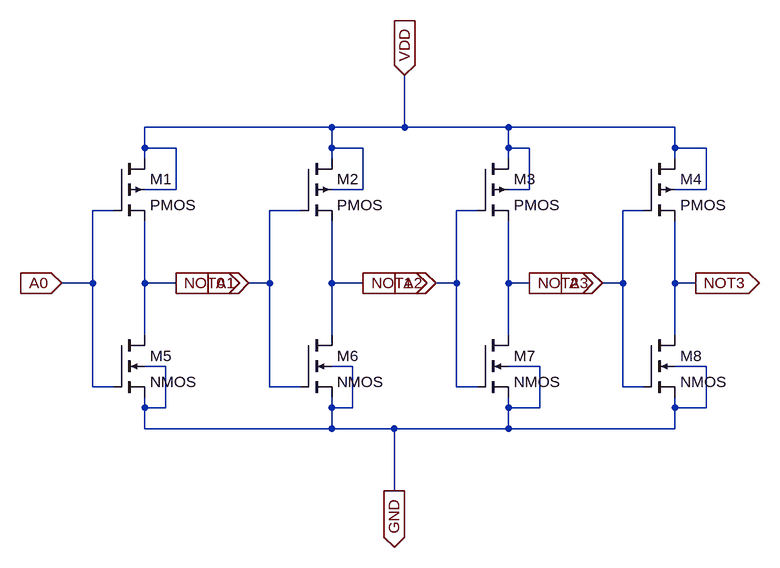
[diagram p0: schematic 4bit_Not.asc]
4bit_Not.asc, the LTspice schematic file:
Version 4.1
SHEET 1 940 680
WIRE 256 -48 -32 -48
WIRE 368 -48 368 -128
WIRE 368 -48 256 -48
WIRE 528 -48 368 -48
WIRE 784 -48 528 -48
WIRE -32 -16 -32 -48
WIRE 16 -16 -32 -16
WIRE 256 -16 256 -48
WIRE 304 -16 256 -16
WIRE 528 -16 528 -48
WIRE 560 -16 528 -16
WIRE 784 -16 784 -48
WIRE 832 -16 784 -16
WIRE -32 0 -32 -16
WIRE 256 0 256 -16
WIRE 528 0 528 -16
WIRE 784 0 784 -16
WIRE 16 48 16 -16
WIRE 16 48 -32 48
WIRE 304 48 304 -16
WIRE 304 48 256 48
WIRE 560 48 560 -16
WIRE 560 48 528 48
WIRE 832 48 832 -16
WIRE 832 48 784 48
WIRE -80 80 -112 80
WIRE 208 80 160 80
WIRE 480 80 448 80
WIRE 736 80 704 80
WIRE -112 192 -112 80
WIRE -112 192 -160 192
WIRE -32 192 -32 96
WIRE 16 192 -32 192
WIRE 160 192 160 80
WIRE 160 192 128 192
WIRE 256 192 256 96
WIRE 304 192 256 192
WIRE 448 192 448 80
WIRE 448 192 416 192
WIRE 528 192 528 96
WIRE 560 192 528 192
WIRE 704 192 704 80
WIRE 704 192 672 192
WIRE 784 192 784 96
WIRE 816 192 784 192
WIRE -32 272 -32 192
WIRE 256 272 256 192
WIRE 528 272 528 192
WIRE 784 272 784 192
WIRE 0 320 -32 320
WIRE 288 320 256 320
WIRE 576 320 528 320
WIRE 832 320 784 320
WIRE -112 352 -112 192
WIRE -80 352 -112 352
WIRE 160 352 160 192
WIRE 208 352 160 352
WIRE 448 352 448 192
WIRE 480 352 448 352
WIRE 704 352 704 192
WIRE 736 352 704 352
WIRE -32 384 -32 368
WIRE 0 384 0 320
WIRE 0 384 -32 384
WIRE 256 384 256 368
WIRE 288 384 288 320
WIRE 288 384 256 384
WIRE 528 384 528 368
WIRE 576 384 576 320
WIRE 576 384 528 384
WIRE 784 384 784 368
WIRE 832 384 832 320
WIRE 832 384 784 384
WIRE -32 416 -32 384
WIRE 256 416 256 384
WIRE 256 416 -32 416
WIRE 352 416 256 416
WIRE 528 416 528 384
WIRE 528 416 352 416
WIRE 784 416 784 384
WIRE 784 416 528 416
WIRE 352 512 352 416
FLAG -160 192 A0
IOPIN -160 192 In
FLAG 128 192 A1
IOPIN 128 192 In
FLAG 416 192 A2
IOPIN 416 192 In
FLAG 672 192 A3
IOPIN 672 192 In
FLAG 16 192 NOT0
IOPIN 16 192 Out
FLAG 304 192 NOT1
IOPIN 304 192 Out
FLAG 560 192 NOT2
IOPIN 560 192 Out
FLAG 816 192 NOT3
IOPIN 816 192 Out
FLAG 368 -128 VDD
IOPIN 368 -128 In
FLAG 352 512 GND
IOPIN 352 512 Out
SYMBOL pmos4 -80 0 R0
SYMATTR InstName M1
SYMBOL pmos4 208 0 R0
SYMATTR InstName M2
SYMBOL pmos4 480 0 R0
SYMATTR InstName M3
SYMBOL pmos4 736 0 R0
SYMATTR InstName M4
SYMBOL nmos4 -80 272 R0
SYMATTR InstName M5
SYMBOL nmos4 208 272 R0
SYMATTR InstName M6
SYMBOL nmos4 480 272 R0
SYMATTR InstName M7
SYMBOL nmos4 736 272 R0
SYMATTR InstName M8

The netlist it stands for:
* 4bit_Not.asc
M1 VDD A0 NOT0 VDD PMOS
M2 VDD A1 NOT1 VDD PMOS
M3 VDD A2 NOT2 VDD PMOS
M4 VDD A3 NOT3 VDD PMOS
M5 NOT0 A0 GND GND NMOS
M6 NOT1 A1 GND GND NMOS
M7 NOT2 A2 GND GND NMOS
M8 NOT3 A3 GND GND NMOS
.model NMOS NMOS
.model PMOS PMOS
.lib standard.mos
.backanno
.end